# EAGLE design tranc_3c (EAGLE 6.5.0)
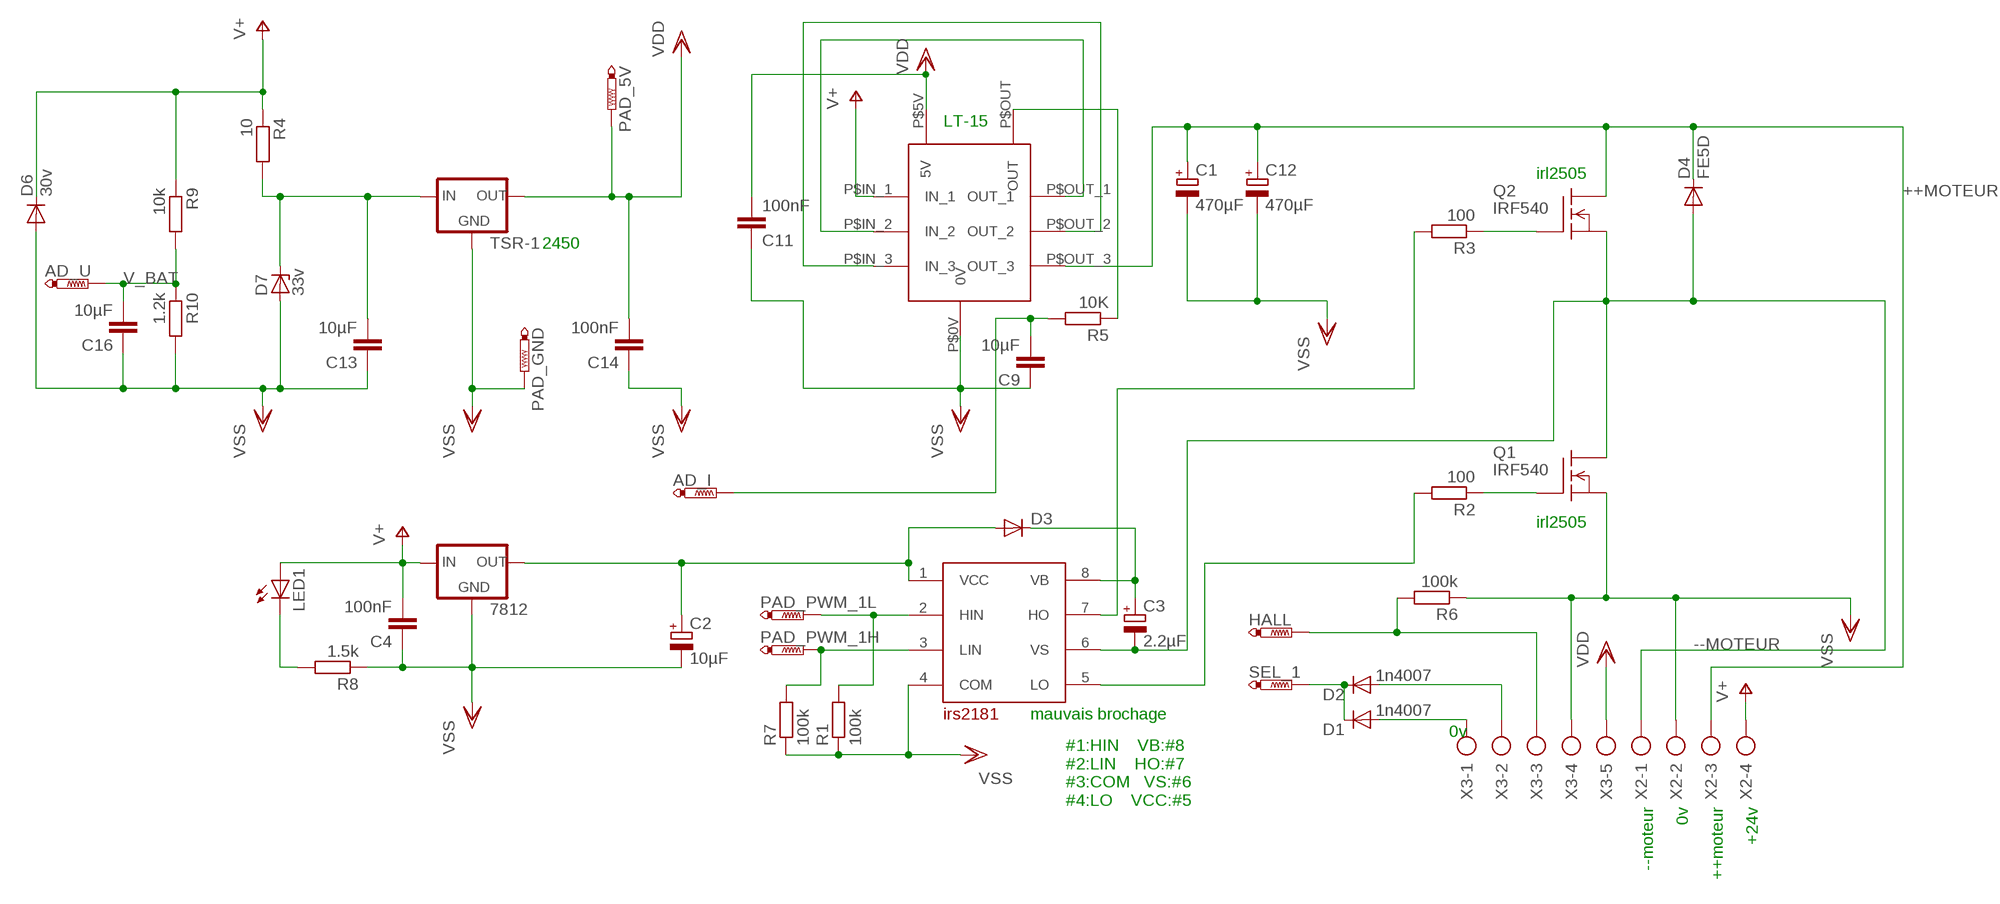
[diagram p0: schematic, sheet 1]

## Parts
7812  78XXS  [78XXS]
AD_I  PTR1TP20SQ  [TP20SQ]
AD_U  PTR1TP20SQ  [TP20SQ]
C1  470µF  CPOL-EUTT5D11L  [TT5D11L]
C2  10µF  CPOL-EUSMCB  [SMC_B]
C3  2.2µF  CPOL-EUSMCB  [SMC_B]
C4  100nF  C-EUC0805K  [C0805K]
C9  10µF  C-EUC1808  [C1808]
C11  100nF  C-EUC0805K  [C0805K]
C12  470µF  CPOL-EUTT5D11L  [TT5D11L]
C13  10µF  C-EUC1808  [C1808]
C14  100nF  C-EUC0805K  [C0805K]
C16  10µF  C-EUC1808  [C1808]
D1  1n4007  DIODE-MINIMELF  [MINIMELF]
D2  1n4007  DIODE-MINIMELF  [MINIMELF]
D3  DIODE-MINIMELF  [MINIMELF]
D4  FE5D  [G4-12]
D6  30v  BY550  [DO27-15]
D7  33v  ZENER-DIODESOD80C  [SOD80C]
HALL  PTR1TP20SQ  [TP20SQ]
LED1  LEDB152  [Q62902-B152]
PAD_5V  PTR1TP20SQ  [TP20SQ]
PAD_GND  PTR1TP20SQ  [TP20SQ]
PAD_PWM_1H  PTR1TP20SQ  [TP20SQ]
PAD_PWM_1L  PTR1TP20SQ  [TP20SQ]
Q1  IRF540  [TO220]
Q2  IRF540  [TO220]
R1  100k  R-EU_M1206  [M1206]
R2  100  R-EU_M0805  [M0805]
R3  100  R-EU_M0805  [M0805]
R4  10  R-EU_M1206  [M1206]
R5  10K  R-EU_M0805  [M0805]
R6  100k  R-EU_M0805  [M0805]
R7  100k  R-EU_M0805  [M0805]
R8  1.5k  R-EU_0309/10  [0309/10]
R9  10k  R-EU_M0805  [M0805]
R10  1.2k  R-EU_M0805  [M0805]
SEL_1  PTR1TP20SQ  [TP20SQ]
TSR-1  78XXS  [78XXS]
U$1  LTS25-NP  [LTS25]
U$2  IRS2181  [SO08]
X2  AK300/4  [AK300/4]
X3  AK300/5  [AK300/5]

## Nets
++MOTEUR: C1.+ C12.+ D4.C Q2.2(D) U$1.P$OUT_3(OUT_3) X2.3
--MOTEUR: C3.- D4.A Q1.2(D) Q2.3(S) U$2.6(VS) X2.1
N$1: Q1.1(G) R2.1
N$2: U$1.P$IN_2(IN_2) U$1.P$OUT_1(OUT_1)
N$3: HALL.TP R6.2 X3.3
N$4: D2.A X3.2
N$5: U$1.P$IN_3(IN_3) U$1.P$OUT_2(OUT_2)
N$6: D1.C D2.C SEL_1.TP
N$8: R5.1 U$1.P$OUT(OUT)
N$10: Q2.1(G) R3.1
N$11: R2.2 U$2.5(LO)
N$12: D1.A X3.1
N$13: C13.2 D7.C R4.2 TSR-1.IN
N$14: C3.+ D3.C U$2.8(VB)
N$15: 7812.OUT C2.+ D3.A U$2.1(VCC)
N$16: PAD_PWM_1L.TP R1.2 U$2.2(HIN)
N$17: PAD_PWM_1H.TP R7.2 U$2.3(LIN)
N$18: R3.2 U$2.7(HO)
N$19: LED1.K(C) R8.2
N$30: AD_I.TP C9.2 R5.2
V+: 7812.IN C4.2 D6.C LED1.A R4.1 R9.1 U$1.P$IN_1(IN_1) X2.4
V_BAT: AD_U.TP C16.2 R9.2 R10.1
VDD: C11.2 C14.2 PAD_5V.TP TSR-1.OUT U$1.P$5V(5V) X3.5
VSS: 7812.GND C1.- C2.- C4.1 C9.1 C11.1 C12.- C13.1 C14.1 C16.1 D6.A D7.A PAD_GND.TP Q1.3(S) R1.1 R6.1 R7.1 R8.1 R10.2 TSR-1.GND U$1.P$0V(0V) U$2.4(COM) X2.2 X3.4

## Notes on the sheet
- LT-15
- irl2505
- 2450
- irl2505
- mauvais brochage
- 0v
- --moteur | 0v | ++moteur | +24v
- #1:HIN    VB:#8
  #2:LIN    HO:#7
  #3:COM   VS:#6
  #4:LO    VCC:#5

## Library data of the parts
7812 TSR-1 = v-reg:78XXS: VOLTAGE REGULATOR
AD_I AD_U HALL PAD_5V PAD_GND PAD_PWM_1H PAD_PWM_1L SEL_1 = testpad:PTR1: TEST PIN
C1-C3 C12 = rcl:CPOL-EU: POLARIZED CAPACITOR, European symbol
C4 C9 C11 C13 C14 C16 = rcl:C-EU: CAPACITOR, European symbol
D1-D3 = diode:DIODE-: DIODE
D4 = diode:FE5D: DIODE
D6 = diode:BY550: DIODE Si200 V, 5 A
D7 = diode:ZENER-DIODE: Z-Diode
LED1 = led:LED: LED OSRAM: - CHIPLED LG R971, LG N971, LY N971, LG Q971, LY Q971, LO R971, LY R971 LH N974, LH R974 LS Q976, LO Q976, LY Q976 LO Q996 - Hyper CHIPLED LW Q18S LB Q993, LB Q99A, LB R99A - SideLED LS A670, LO A670, LY A670, LG A670, LP A670 LB A673, LV A673, LT A673, LW A673 LH A674 LY A675 LS A676, LA A676, LO A676, LY A676, LW A676 LS A679, LY A679, LG A679 - Hyper Micro SIDELED® LS Y876, LA Y876, LO Y876, LY Y876 LT Y87S - SmartLED LW L88C, LW L88S LB L89C, LB L89S, LG L890 LS L89K, LO L89K, LY L89K LS L896, LA L896, LO L896, LY L896 - TOPLED LS T670, LO T670, LY T670, LG T670, LP T670 LSG T670, LSP T670, LSY T670, LOP T670, LYG T670 LG T671, LOG T671, LSG T671 LB T673, LV T673, LT T673, LW T673 LH T674 LS T676, LA T676, LO T676, LY T676, LB T676, LH T676, LSB T676, LW T676 LB T67C, LV T67C, LT T67C, LS T67K, LO T67K, LY T67K, LW E67C LS E67B, LA E67B, LO E67B, LY E67B, LB E67C, LV E67C, LT E67C LW T67C LS T679, LY T679, LG T679 LS T770, LO T770, LY T770, LG T770, LP T770 LB T773, LV T773, LT T773, LW T773 LH T774 LS E675, LA E675, LY E675, LS T675 LS T776, LA T776, LO T776, LY T776, LB T776 LHGB T686 LT T68C, LB T68C - Hyper Mini TOPLED® LB M676 - Mini TOPLED Santana® LG M470 LS M47K, LO M47K, LY M47K Source: http://www.osram.convergy.de LUXEON: - LUMILED® LXK2-PW12-R00, LXK2-PW12-S00, LXK2-PW14-U00, LXK2-PW14-V00 LXK2-PM12-R00, LXK2-PM12-S00, LXK2-PM14-U00 LXK2-PE12-Q00, LXK2-PE12-R00, LXK2-PE12-S00, LXK2-PE14-T00, LXK2-PE14-U00 LXK2-PB12-K00, LXK2-PB12-L00, LXK2-PB12-M00, LXK2-PB14-N00, LXK2-PB14-P00, LXK2-PB14-Q00 LXK2-PR12-L00, LXK2-PR12-M00, LXK2-PR14-Q00, LXK2-PR14-R00 LXK2-PD12-Q00, LXK2-PD12-R00, LXK2-PD12-S00 LXK2-PH12-R00, LXK2-PH12-S00 LXK2-PL12-P00, LXK2-PL12-Q00, LXK2-PL12-R00 Source: www.luxeon.com KINGBRIGHT: KA-3528ASYC Source: www.kingbright.com
Q1 Q2 = transistor-fet:IRF540: N-Channel Enhancement MOSFET (HEXFET); 100V; 28A; 0,077Ohm
R1-R10 = rcl:R-EU_: RESISTOR, European symbol
U$1 = lem:LTS25-NP
U$2 = ir:IRS2181
X2 = con-ptr500:AK300/4: CONNECTOR; OC_FARNELL: unknown; OC_NEWARK: unknown
X3 = con-ptr500:AK300/5: CONNECTOR; OC_FARNELL: unknown; OC_NEWARK: unknown

## Board
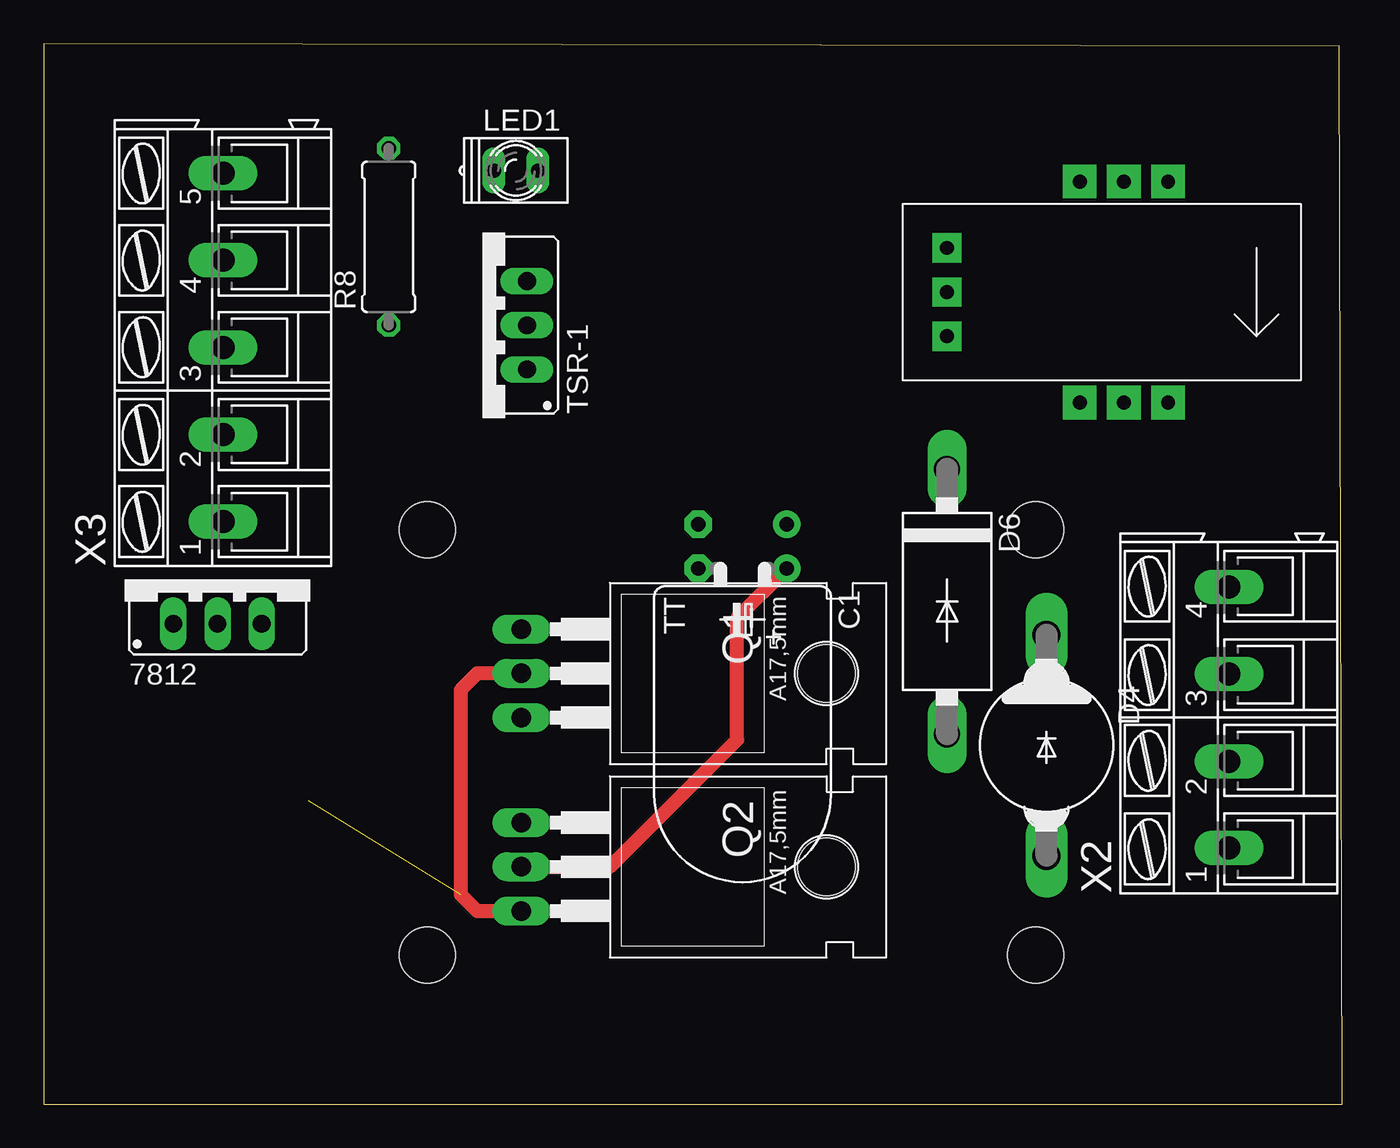
[diagram p1: board, top side]
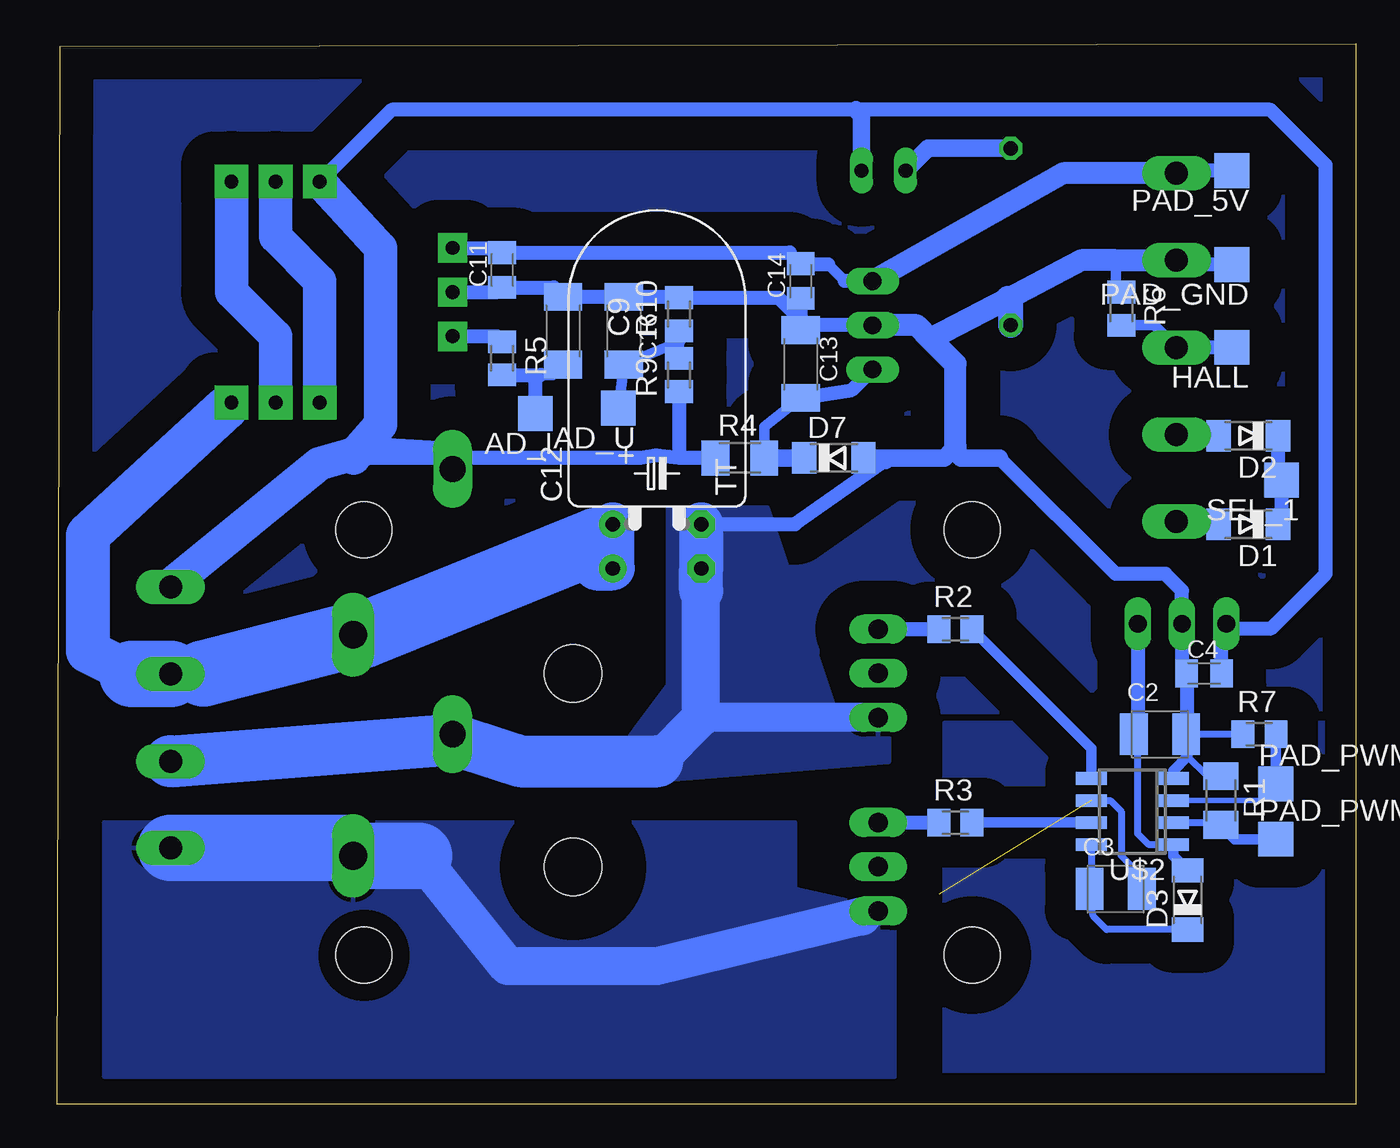
[diagram p2: board, bottom side, seen from below]

Size 74.6 x 60.95 mm. Coordinates in mm from the lower left corner, seen from the top.
Outline: 0,0 74.6,0 74.45,60.79 0,60.95 0,0
Copper layers (1*16): Top 0.035mm / dielectric 1.5mm / Bottom 0.035mm
Design rules "default": minimum track width 10mil, minimum drill 24mil, track to track 8mil, track to pad 8mil, pad to pad 8mil, via to via 8mil, smd to smd 8mil, copper to edge 40mil, drill to drill 8mil, minimum pad ring 10mil, minimum via ring 8mil, stop-mask expansion 4mil, vias tented up to drill 0mil, thermal gap 10mil
Holes 3.2 mm at 56.98,8.57 22.06,8.57 22.06,33.02 56.98,33.02

### Footprints (pad centres in the part's own frame; a part is rotated, then mirrored left to right if it is on the bottom)
78XXS = drill 1.016 long: GND 0,-2.54; IN -2.54,-2.54; OUT 2.54,-2.54
TP20SQ = smd 2 x 2: TP 0,0
TT5D11L = drill 0.813 pad 1.6: + -2.54,0 | drill 0.813 pad 1.6 octagon: - 2.54,0
SMC_B = smd 1.6 x 2.4: + -1.5,0; - 1.5,0
C0805K = smd 1.3 x 1.6: 1 -1,0; 2 1,0
C1808 = smd 1.6 x 2.2: 1 -1.95,0; 2 1.95,0
MINIMELF = smd 1.4 x 1.8: A 1.7,0; C -1.7,0
G4-12 = drill 1.6 long: A 6.35,0; C -6.35,0
DO27-15 = drill 1.499 long: A 7.62,0; C -7.62,0
SOD80C = smd 1.4 x 1.8: A 1.7,0; C -1.7,0
Q62902-B152 = drill 0.813 long: A 1.27,0; K -1.27,0
TO220 = drill 1.118 long: 1 -2.54,-6.35; 2 0,-6.35; 3 2.54,-6.35 | hole 3.302: 0,11.176
M1206 = smd 1.6 x 2: 1 -1.4,0; 2 1.4,0
M0805 = smd 1.3 x 1.6: 1 -0.95,0; 2 0.95,0
0309/10 = drill 0.813 octagon: 1 -5.08,0; 2 5.08,0
LTS25 = drill 0.8 pad 1.676 square: P$0V -10.16,0; P$5V -10.16,2.54; P$OUT -10.16,-2.54 | drill 0.8 pad 1.93 square: P$IN_1 -2.54,6.35; P$IN_2 0,6.35; P$IN_3 2.54,6.35; P$OUT_1 -2.54,-6.35; P$OUT_2 0,-6.35; P$OUT_3 2.54,-6.35
SO08 = smd 0.72 x 1.78: 1 -1.905,-2.35; 2 -0.635,-2.35; 3 0.635,-2.35; 4 1.905,-2.35; 5 1.905,2.35; 6 0.635,2.35; 7 -0.635,2.35; 8 -1.905,2.35
AK300/4 = drill 1.321 long: 1 -7.493,0; 2 -2.515,0; 3 2.515,0; 4 7.493,0
AK300/5 = drill 1.321 long: 1 -10.008,0; 2 -5.004,0; 3 0,0; 4 5.004,0; 5 10.008,0

### Placement (x,y rotation side)
7812  10,30.16 0 top
AD_I  47.14,39.68 180 bottom
AD_U  42.38,40 180 bottom
C1  40.16,30.79 180 top
C2  11.27,21.27 0 bottom
C3  13.81,12.38 0 bottom
C4  8.73,24.76 0 bottom
C9  45.55,44.45 270 bottom
C11  49.05,47.94 90 bottom
C12  40.16,33.33 0 bottom
C13  31.9,42.54 270 bottom
C14  31.9,47.3 90 bottom
C16  42.06,44.45 270 bottom
D1  6.18,33.33 180 bottom
D2  6.18,38.41 180 bottom
D3  9.68,11.74 90 bottom
D4  57.62,20.63 270 top
D6  51.91,28.89 270 top
D7  30,37.14 0 bottom
HALL  7.14,43.49 180 bottom
LED1  27.14,53.65 0 top
PAD_5V  7.14,53.65 180 bottom
PAD_GND  7.14,48.26 180 bottom
PAD_PWM_1H  4.6,18.41 0 bottom
PAD_PWM_1L  4.6,15.24 0 bottom
Q1  33.81,24.76 270 top
Q2  33.81,13.65 270 top
R1  7.77,17.46 270 bottom
R2  23.01,27.3 0 bottom
R3  23.01,16.19 0 bottom
R4  35.39,37.14 0 bottom
R5  49.05,42.86 270 bottom
R6  13.49,45.72 270 bottom
R7  5.55,21.27 0 bottom
R8  19.84,49.84 90 top
R9  38.89,41.91 90 bottom
R10  38.89,45.4 90 bottom
SEL_1  4.28,35.87 180 bottom
TSR-1  25.23,44.76 90 top
U$1  62.06,46.67 0 top
U$2  12.85,16.82 90 bottom
X2  68.1,22.22 90 top
X3  10.31,43.49 90 top

### Tracks (layer width: path | path; a pad name or v marks a point on that pad's centre or on a via)
++MOTEUR
  Top 0.813: Q2.2 32.54,13.65 39.84,20.95 39.84,27.93 C1.+
  Bottom 1.27: U$1.P$OUT_3 64.92,40
  Bottom 2.184: D4.C 56.98,26.98
  Bottom 2.54: 70.3,24.73 72.86,26.03 72.86,32.7 64.92,40 | C12.+ C1.+ 43.65,30.79 43.65,32.38 | X2.3 67.46,24.76 66.19,24.76 65.56,24.76
  Bottom 3.81: X2.3 70.3,24.73 | 56.98,26.98 43.65,32.38 | 66.19,24.76 D4.C
--MOTEUR  (1 unrouted)
  Top 0.813: Q1.2 24.92,24.76 23.96,23.81 23.96,12.06 24.92,11.11 Q2.3
  Bottom 0.406: U$2.6 14.12,17.46 13.49,16.82 13.49,14.28 12.22,13.01 12.22,12.47 C3.-
  Bottom 1.676: Q2.3 28.41,10.79 | 58.06,14.73 D4.A
  Bottom 2.184: 28.41,10.79 40.16,7.93 48.73,7.93 53.81,14.28
  Bottom 3.81: X2.1 58.06,14.73 | 53.81,14.28 D4.A
  pour Bottom: 26.5,11.11 26.5,1.58 71.91,1.58 71.91,16.19 32.22,16.19 32.22,12.38
N$1
  Bottom 0.813: Q1.1 R2.1
N$2
  Bottom 1.93: U$1.P$IN_2 62.06,49.84 59.52,47.3 U$1.P$OUT_1
N$3
  Bottom 0.61: R6.2 11.59,44.77 X3.3
  Bottom 0.813: HALL.TP X3.3
N$4
  Bottom 0.61: 10.24,38.41 X3.2
  Bottom 0.813: D2.A 10.24,38.41
N$5
  Bottom 1.93: U$1.P$IN_3 64.61,46.67 62.06,44.13 U$1.P$OUT_2
N$6
  Bottom 0.61: 4.48,36.08 SEL_1.TP | 4.28,33.54 D1.C
  Bottom 0.813: D2.C 4.48,36.08 | SEL_1.TP 4.28,33.54
N$8
  Bottom 0.61: 49.37,44.13 R5.1
  Bottom 0.813: U$1.P$OUT 49.37,44.13
N$9
  pour Bottom (isolate 1.93): 0.15,60.64 74.13,60.64 74.45,22.54 0.47,22.54
N$10
  Bottom 0.813: Q2.1 R3.1
N$11
  Bottom 0.61: U$2.5 15.2,20.44 R2.2
N$12
  Bottom 0.61: 10.16,33.33 X3.1
  Bottom 0.813: D1.A 10.16,33.33
N$13
  Bottom 0.61: R4.2 33.99,38.95 C13.2
  Bottom 0.813: C13.2 28.96,41.04 TSR-1.IN
  Bottom 1.016: R4.2 D7.C
N$14
  Bottom 0.406: U$2.8 15.2,12.48 C3.+ 15.39,12.29 15.08,10.79 14.33,10.04 D3.C
N$15
  Bottom 0.406: U$2.1 11.9,14.92 12.54,15.55 12.54,21.18
  Bottom 0.61: 12.54,21.18 C2.+ | U$2.1 10.5,14.27 D3.A
  Bottom 0.813: 7812.OUT 12.54,21.5 C2.+
N$16
  Bottom 0.406: U$2.2 7.9,16.19 R1.2
  Bottom 0.61: PAD_PWM_1L.TP 6.95,15.24 R1.2
N$17
  Bottom 0.305: U$2.3 5.55,17.46 PAD_PWM_1H.TP
  Bottom 0.406: PAD_PWM_1H.TP
  Bottom 0.61: R7.2 PAD_PWM_1H.TP
N$18
  Bottom 0.61: U$2.7 R3.2
N$19
  Bottom 1.016: R8.2 24.6,54.92 LED1.K
N$20
  pour Bottom (isolate 1.778): 0.79,21.9 0.79,1.27 23.65,1.27 23.65,21.9 1.1,21.9
N$30
  Bottom 0.61: C9.2 46.14,41.91 46.82,41.91 47.14,41.59
  Bottom 0.813: R5.2 46.82,41.91 | AD_I.TP 47.14,41.59
V+
  Bottom 0.406: 57.63,37.78 57.31,37.57
  Bottom 0.61: 39.12,41.04 R9.1 | 38.89,37.14 39.75,37.14 40.21,37.29
  Bottom 0.813: R9.1 38.89,37.14 | 38.89,37.14 40.21,37.29 41.11,37.14 57.59,37.14 | R4.1 38.89,37.14 | C4.2 7.72,27.35 | 7.72,27.35 7812.IN | 7.72,27.35 4.87,27.35 1.74,30.47 1.74,53.97 4.92,57.15 28.73,57.15 55.4,57.15 U$1.P$IN_1
  Bottom 1.016: LED1.A 28.41,56.83 28.73,57.15
  Bottom 1.27: 57.3,37.46 57.21,37.71 | X2.4 68.1,29.84 | D6.C 52.22,36.51 52.22,37.46 57.63,37.78
  Bottom 1.93: 57.3,37.46 59.52,36.83 68.1,29.84 | U$1.P$IN_1 56.03,49.21 56.03,39.05 57.21,37.71 57.31,37.57 57.59,37.14
V_BAT
  Bottom 0.61: R9.2 R10.1 38.84,43.81 C16.2 AD_U.TP
VDD
  Bottom 0.61: 49.32,49.21 C11.2 | 29.36,47.3 30.31,48.26 | 31.86,48.26 C14.2 32.54,48.94 | 10.16,53.65 X3.5
  Bottom 0.813: U$1.P$5V 49.32,49.21 | TSR-1.OUT 29.36,47.3 | 30.31,48.26 31.86,48.26 | C11.2 32.54,48.94 | PAD_5V.TP 10.16,53.65
  Bottom 1.27: X3.5 16.81,53.5 TSR-1.OUT
VSS
  Bottom 0.406: R1.1 8.54,18.86 9.68,20 | R7.1 C2.-
  Bottom 0.61: 49.32,46.67 C11.1 | 46.1,46.94 C9.1 | 31.58,44.76 31.9,44.76 | 41.75,46.4 C16.1 | 39.25,46.4 R10.2 | 13.81,46.66 13.81,48.5 | U$2.4 10.5,19.17 9.68,20 9.68,21.18 C2.-
  Bottom 0.813: U$1.P$0V 49.32,46.67 | C11.1 46.1,46.94 | TSR-1.GND 31.58,44.76 33.17,46.35 R10.2 | C13.1 31.9,44.76 C14.1 | C9.1 41.75,46.4 | C16.1 39.25,46.4 | PAD_GND.TP 10.07,48.26 X3.4 | C12.- 32.22,33.33 27.03,36.99 26.82,37.14 | C2.- 9.73,21.31 C4.1 10,25.03 7812.GND 10,29.52 10.95,30.47 13.81,30.47 20.47,37.14 | 13.81,46.66 R6.1
  Bottom 1.016: 23.17,37.62 23.65,37.14 D7.A 27.18,37.14 27.03,36.99 | 23.17,37.62 23.01,37.78 | 20.47,37.14 22.7,37.14 23.17,37.62
  Bottom 1.27: 23.01,37.78 23.01,42.54 24.44,43.97 | 24.44,43.97 25.23,44.76 TSR-1.GND | 24.44,43.97 19.98,46.3 15.79,48.5 13.81,48.5 X3.4 | D6.A 51.91,20.97
  Bottom 1.422: R8.1 19.84,46.16 19.98,46.3
  Bottom 1.676: Q1.3 37.62,22.22
  Bottom 2.184: 40.13,19.7 37.62,22.22 37.62,29.52
  Bottom 2.54: C12.- C1.- 37.62,29.52
  Bottom 3: X2.2 51.91,20.97 48,19.7 40.13,19.7
  pour Bottom: 30,22.86 33.81,34.29 39.52,34.29 39.52,24.12 42.38,20.31 42.38,18.41 26.82,19.68 26.82,22.54

### Text on the board
Bottom: trancannage bottom